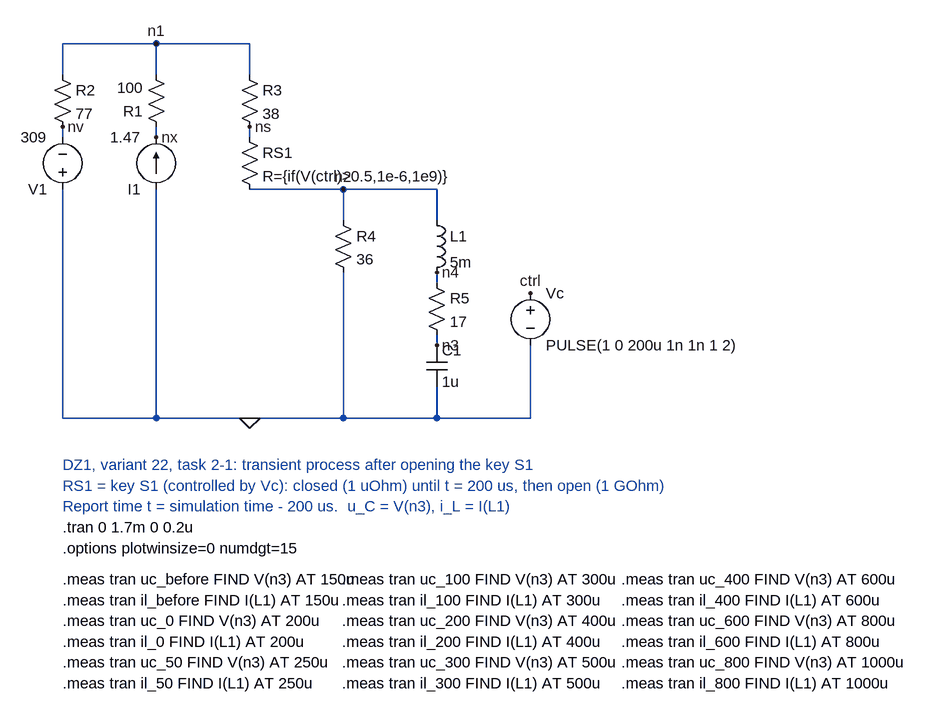
[diagram p0: schematic task21_tran_var22.asc]
task21_tran_var22.asc, the LTspice schematic file:
Version 4
SHEET 1 1300 1176
WIRE 192 128 192 176
WIRE 192 256 192 272
WIRE 192 352 192 704
WIRE 336 128 336 176
WIRE 336 256 336 272
WIRE 336 352 336 704
WIRE 480 128 480 176
WIRE 480 256 480 272
WIRE 624 352 624 400
WIRE 624 480 624 704
WIRE 768 352 768 400
WIRE 768 480 768 496
WIRE 768 576 768 592
WIRE 768 656 768 704
WIRE 192 128 336 128
WIRE 336 128 480 128
WIRE 480 352 624 352
WIRE 624 352 768 352
WIRE 912 592 912 704
WIRE 192 704 336 704
WIRE 336 704 480 704
WIRE 480 704 624 704
WIRE 624 704 768 704
WIRE 768 704 912 704
FLAG 912 512 ctrl
FLAG 480 704 0
FLAG 336 128 n1
FLAG 624 352 n2
FLAG 768 592 n3
FLAG 768 480 n4
FLAG 192 256 nv
FLAG 480 256 ns
FLAG 336 272 nx
SYMBOL res 176 160 R0
SYMATTR InstName R2
SYMATTR Value 77
SYMBOL voltage 192 368 R180
SYMATTR InstName V1
SYMATTR Value 309
SYMBOL res 352 272 R180
SYMATTR InstName R1
SYMATTR Value 100
SYMBOL current 336 352 R180
SYMATTR InstName I1
SYMATTR Value 1.47
SYMBOL res 464 160 R0
SYMATTR InstName R3
SYMATTR Value 38
SYMBOL res 464 256 R0
SYMATTR InstName RS1
SYMATTR Value R={if(V(ctrl)>0.5,1e-6,1e9)}
SYMBOL res 608 384 R0
SYMATTR InstName R4
SYMATTR Value 36
SYMBOL ind 752 384 R0
SYMATTR InstName L1
SYMATTR Value 5m
SYMBOL res 752 480 R0
SYMATTR InstName R5
SYMATTR Value 17
SYMBOL cap 752 592 R0
SYMATTR InstName C1
SYMATTR Value 1u
SYMBOL voltage 912 496 R0
SYMATTR InstName Vc
SYMATTR Value PULSE(1 0 200u 1n 1n 1 2)
TEXT 192 776 Left 2 ;DZ1, variant 22, task 2-1: transient process after opening the key S1
TEXT 192 808 Left 2 ;RS1 = key S1 (controlled by Vc): closed (1 uOhm) until t = 200 us, then open (1 GOhm)
TEXT 192 840 Left 2 ;Report time t = simulation time - 200 us.  u_C = V(n3), i_L = I(L1)
TEXT 192 872 Left 2 !.tran 0 1.7m 0 0.2u
TEXT 192 904 Left 2 !.options plotwinsize=0 numdgt=15
TEXT 192 952 Left 2 !.meas tran uc_before FIND V(n3) AT 150u
TEXT 192 984 Left 2 !.meas tran il_before FIND I(L1) AT 150u
TEXT 192 1016 Left 2 !.meas tran uc_0 FIND V(n3) AT 200u
TEXT 192 1048 Left 2 !.meas tran il_0 FIND I(L1) AT 200u
TEXT 192 1080 Left 2 !.meas tran uc_50 FIND V(n3) AT 250u
TEXT 192 1112 Left 2 !.meas tran il_50 FIND I(L1) AT 250u
TEXT 622 952 Left 2 !.meas tran uc_100 FIND V(n3) AT 300u
TEXT 622 984 Left 2 !.meas tran il_100 FIND I(L1) AT 300u
TEXT 622 1016 Left 2 !.meas tran uc_200 FIND V(n3) AT 400u
TEXT 622 1048 Left 2 !.meas tran il_200 FIND I(L1) AT 400u
TEXT 622 1080 Left 2 !.meas tran uc_300 FIND V(n3) AT 500u
TEXT 622 1112 Left 2 !.meas tran il_300 FIND I(L1) AT 500u
TEXT 1052 952 Left 2 !.meas tran uc_400 FIND V(n3) AT 600u
TEXT 1052 984 Left 2 !.meas tran il_400 FIND I(L1) AT 600u
TEXT 1052 1016 Left 2 !.meas tran uc_600 FIND V(n3) AT 800u
TEXT 1052 1048 Left 2 !.meas tran il_600 FIND I(L1) AT 800u
TEXT 1052 1080 Left 2 !.meas tran uc_800 FIND V(n3) AT 1000u
TEXT 1052 1112 Left 2 !.meas tran il_800 FIND I(L1) AT 1000u

The netlist it stands for:
* task21_tran_var22.asc
R2 n1 nv 77
V1 0 nv 309
R1 nx n1 100
I1 0 nx 1.47
R3 n1 ns 38
RS1 ns n2 R={if(V(ctrl)>0.5,1e-6,1e9)}
R4 n2 0 36
L1 n2 n4 5m
R5 n4 n3 17
C1 n3 0 1u
Vc ctrl 0 PULSE(1 0 200u 1n 1n 1 2)
* DZ1, variant 22, task 2-1: transient process after opening the key S1
* RS1 = key S1 (controlled by Vc): closed (1 uOhm) until t = 200 us, then open (1 GOhm)
* Report time t = simulation time - 200 us.  u_C = V(n3), i_L = I(L1)
.tran 0 1.7m 0 0.2u
.options plotwinsize=0 numdgt=15
.meas tran uc_before FIND V(n3) AT 150u
.meas tran il_before FIND I(L1) AT 150u
.meas tran uc_0 FIND V(n3) AT 200u
.meas tran il_0 FIND I(L1) AT 200u
.meas tran uc_50 FIND V(n3) AT 250u
.meas tran il_50 FIND I(L1) AT 250u
.meas tran uc_100 FIND V(n3) AT 300u
.meas tran il_100 FIND I(L1) AT 300u
.meas tran uc_200 FIND V(n3) AT 400u
.meas tran il_200 FIND I(L1) AT 400u
.meas tran uc_300 FIND V(n3) AT 500u
.meas tran il_300 FIND I(L1) AT 500u
.meas tran uc_400 FIND V(n3) AT 600u
.meas tran il_400 FIND I(L1) AT 600u
.meas tran uc_600 FIND V(n3) AT 800u
.meas tran il_600 FIND I(L1) AT 800u
.meas tran uc_800 FIND V(n3) AT 1000u
.meas tran il_800 FIND I(L1) AT 1000u
.backanno
.end